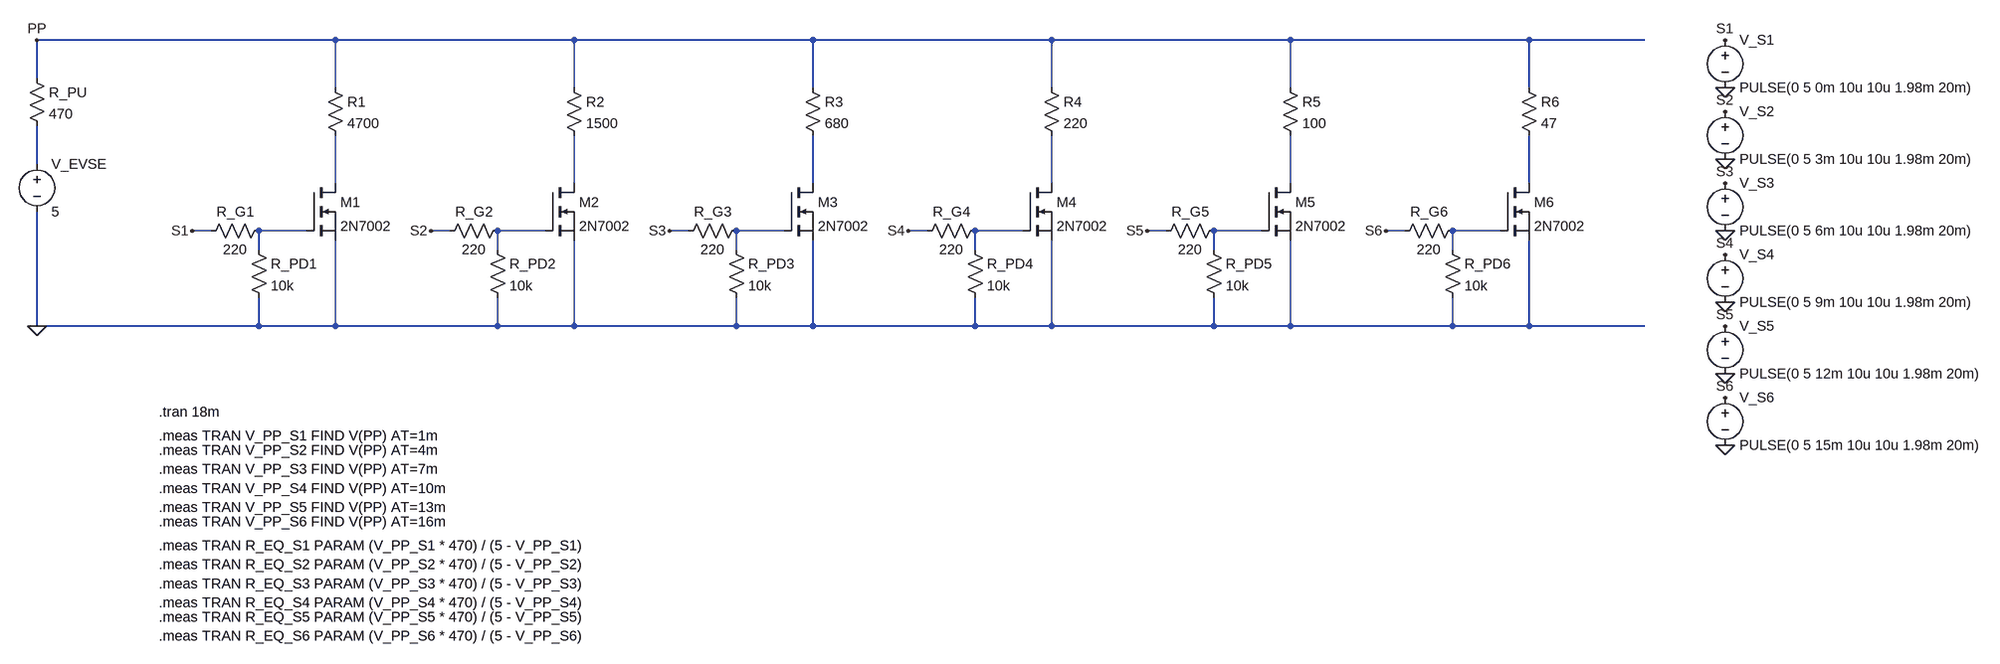
[diagram p0: schematic Barramento_PP_2N7002.asc]
Barramento_PP_2N7002.asc, the LTspice schematic file:
Version 4.1
SHEET 1 3256 1400
WIRE 400 80 -100 80
WIRE 800 80 400 80
WIRE 1200 80 800 80
WIRE 1600 80 1200 80
WIRE 2000 80 1600 80
WIRE 2400 80 2000 80
WIRE 2600 80 2400 80
WIRE -100 144 -100 80
WIRE 400 160 400 80
WIRE 800 160 800 80
WIRE 1200 160 1200 80
WIRE 1600 160 1600 80
WIRE 2000 160 2000 80
WIRE 2400 160 2400 80
WIRE -100 288 -100 224
WIRE 400 320 400 240
WIRE 800 320 800 240
WIRE 1200 320 1200 240
WIRE 1600 320 1600 240
WIRE 2000 320 2000 240
WIRE 2400 320 2400 240
WIRE 192 400 160 400
WIRE 352 400 272 400
WIRE 592 400 560 400
WIRE 752 400 672 400
WIRE 992 400 960 400
WIRE 1152 400 1072 400
WIRE 1392 400 1360 400
WIRE 1552 400 1472 400
WIRE 1792 400 1760 400
WIRE 1952 400 1872 400
WIRE 2192 400 2160 400
WIRE 2352 400 2272 400
WIRE 272 432 272 400
WIRE 672 432 672 400
WIRE 1072 432 1072 400
WIRE 1472 432 1472 400
WIRE 1872 432 1872 400
WIRE 2272 432 2272 400
WIRE -100 560 -100 368
WIRE 272 560 272 512
WIRE 272 560 -100 560
WIRE 400 560 400 416
WIRE 400 560 272 560
WIRE 672 560 672 512
WIRE 672 560 400 560
WIRE 800 560 800 416
WIRE 800 560 672 560
WIRE 1072 560 1072 512
WIRE 1072 560 800 560
WIRE 1200 560 1200 416
WIRE 1200 560 1072 560
WIRE 1472 560 1472 512
WIRE 1472 560 1200 560
WIRE 1600 560 1600 416
WIRE 1600 560 1472 560
WIRE 1872 560 1872 512
WIRE 1872 560 1600 560
WIRE 2000 560 2000 416
WIRE 2000 560 1872 560
WIRE 2272 560 2272 512
WIRE 2272 560 2000 560
WIRE 2400 560 2400 416
WIRE 2400 560 2272 560
WIRE 2600 560 2400 560
FLAG -100 80 PP
FLAG -100 560 0
FLAG 160 400 S1
FLAG 560 400 S2
FLAG 960 400 S3
FLAG 1360 400 S4
FLAG 1760 400 S5
FLAG 2160 400 S6
FLAG 2800 160 0
FLAG 2800 280 0
FLAG 2800 400 0
FLAG 2800 520 0
FLAG 2800 640 0
FLAG 2800 760 0
FLAG 2800 80 S1
FLAG 2800 200 S2
FLAG 2800 320 S3
FLAG 2800 440 S4
FLAG 2800 560 S5
FLAG 2800 680 S6
SYMBOL res -116 128 R0
SYMATTR InstName R_PU
SYMATTR Value 470
SYMBOL voltage -100 272 R0
WINDOW 123 0 0 Left 2
WINDOW 39 0 0 Left 2
SYMATTR InstName V_EVSE
SYMATTR Value 5
SYMBOL res 384 144 R0
SYMATTR InstName R1
SYMATTR Value 4700
SYMBOL nmos 352 320 R0
SYMATTR InstName M1
SYMATTR Value 2N7002
SYMBOL res 256 416 R0
SYMATTR InstName R_PD1
SYMATTR Value 10k
SYMBOL res 288 384 R90
WINDOW 0 0 56 VBottom 2
WINDOW 3 32 56 VTop 2
SYMATTR InstName R_G1
SYMATTR Value 220
SYMBOL res 784 144 R0
SYMATTR InstName R2
SYMATTR Value 1500
SYMBOL nmos 752 320 R0
SYMATTR InstName M2
SYMATTR Value 2N7002
SYMBOL res 656 416 R0
SYMATTR InstName R_PD2
SYMATTR Value 10k
SYMBOL res 688 384 R90
WINDOW 0 0 56 VBottom 2
WINDOW 3 32 56 VTop 2
SYMATTR InstName R_G2
SYMATTR Value 220
SYMBOL res 1184 144 R0
SYMATTR InstName R3
SYMATTR Value 680
SYMBOL nmos 1152 320 R0
SYMATTR InstName M3
SYMATTR Value 2N7002
SYMBOL res 1056 416 R0
SYMATTR InstName R_PD3
SYMATTR Value 10k
SYMBOL res 1088 384 R90
WINDOW 0 0 56 VBottom 2
WINDOW 3 32 56 VTop 2
SYMATTR InstName R_G3
SYMATTR Value 220
SYMBOL res 1584 144 R0
SYMATTR InstName R4
SYMATTR Value 220
SYMBOL nmos 1552 320 R0
SYMATTR InstName M4
SYMATTR Value 2N7002
SYMBOL res 1456 416 R0
SYMATTR InstName R_PD4
SYMATTR Value 10k
SYMBOL res 1488 384 R90
WINDOW 0 0 56 VBottom 2
WINDOW 3 32 56 VTop 2
SYMATTR InstName R_G4
SYMATTR Value 220
SYMBOL res 1984 144 R0
SYMATTR InstName R5
SYMATTR Value 100
SYMBOL nmos 1952 320 R0
SYMATTR InstName M5
SYMATTR Value 2N7002
SYMBOL res 1856 416 R0
SYMATTR InstName R_PD5
SYMATTR Value 10k
SYMBOL res 1888 384 R90
WINDOW 0 0 56 VBottom 2
WINDOW 3 32 56 VTop 2
SYMATTR InstName R_G5
SYMATTR Value 220
SYMBOL res 2384 144 R0
SYMATTR InstName R6
SYMATTR Value 47
SYMBOL nmos 2352 320 R0
SYMATTR InstName M6
SYMATTR Value 2N7002
SYMBOL res 2256 416 R0
SYMATTR InstName R_PD6
SYMATTR Value 10k
SYMBOL res 2288 384 R90
WINDOW 0 0 56 VBottom 2
WINDOW 3 32 56 VTop 2
SYMATTR InstName R_G6
SYMATTR Value 220
SYMBOL voltage 2800 64 R0
WINDOW 123 0 0 Left 2
WINDOW 39 0 0 Left 2
SYMATTR InstName V_S1
SYMATTR Value PULSE(0 5 0m 10u 10u 1.98m 20m)
SYMBOL voltage 2800 184 R0
WINDOW 123 0 0 Left 2
WINDOW 39 0 0 Left 2
SYMATTR InstName V_S2
SYMATTR Value PULSE(0 5 3m 10u 10u 1.98m 20m)
SYMBOL voltage 2800 304 R0
WINDOW 123 0 0 Left 2
WINDOW 39 0 0 Left 2
SYMATTR InstName V_S3
SYMATTR Value PULSE(0 5 6m 10u 10u 1.98m 20m)
SYMBOL voltage 2800 424 R0
WINDOW 123 0 0 Left 2
WINDOW 39 0 0 Left 2
SYMATTR InstName V_S4
SYMATTR Value PULSE(0 5 9m 10u 10u 1.98m 20m)
SYMBOL voltage 2800 544 R0
WINDOW 123 0 0 Left 2
WINDOW 39 0 0 Left 2
SYMATTR InstName V_S5
SYMATTR Value PULSE(0 5 12m 10u 10u 1.98m 20m)
SYMBOL voltage 2800 664 R0
WINDOW 123 0 0 Left 2
WINDOW 39 0 0 Left 2
SYMATTR InstName V_S6
SYMATTR Value PULSE(0 5 15m 10u 10u 1.98m 20m)
TEXT 104 704 Left 2 !.tran 18m
TEXT 104 744 Left 2 !.meas TRAN V_PP_S1 FIND V(PP) AT=1m
TEXT 104 768 Left 2 !.meas TRAN V_PP_S2 FIND V(PP) AT=4m
TEXT 104 800 Left 2 !.meas TRAN V_PP_S3 FIND V(PP) AT=7m
TEXT 104 832 Left 2 !.meas TRAN V_PP_S4 FIND V(PP) AT=10m
TEXT 104 864 Left 2 !.meas TRAN V_PP_S5 FIND V(PP) AT=13m
TEXT 104 888 Left 2 !.meas TRAN V_PP_S6 FIND V(PP) AT=16m
TEXT 104 928 Left 2 !.meas TRAN R_EQ_S1 PARAM (V_PP_S1 * 470) / (5 - V_PP_S1)
TEXT 104 960 Left 2 !.meas TRAN R_EQ_S2 PARAM (V_PP_S2 * 470) / (5 - V_PP_S2)
TEXT 104 992 Left 2 !.meas TRAN R_EQ_S3 PARAM (V_PP_S3 * 470) / (5 - V_PP_S3)
TEXT 104 1024 Left 2 !.meas TRAN R_EQ_S4 PARAM (V_PP_S4 * 470) / (5 - V_PP_S4)
TEXT 104 1048 Left 2 !.meas TRAN R_EQ_S5 PARAM (V_PP_S5 * 470) / (5 - V_PP_S5)
TEXT 104 1080 Left 2 !.meas TRAN R_EQ_S6 PARAM (V_PP_S6 * 470) / (5 - V_PP_S6)

The netlist it stands for:
* Barramento_PP_2N7002.asc
R_PU PP N001 470
V_EVSE N001 0 5
R1 PP N002 4700
M1 N002 N008 0 0 2N7002
R_PD1 N008 0 10k
R_G1 N008 S1 220
R2 PP N003 1500
M2 N003 N009 0 0 2N7002
R_PD2 N009 0 10k
R_G2 N009 S2 220
R3 PP N004 680
M3 N004 N010 0 0 2N7002
R_PD3 N010 0 10k
R_G3 N010 S3 220
R4 PP N005 220
M4 N005 N011 0 0 2N7002
R_PD4 N011 0 10k
R_G4 N011 S4 220
R5 PP N006 100
M5 N006 N012 0 0 2N7002
R_PD5 N012 0 10k
R_G5 N012 S5 220
R6 PP N007 47
M6 N007 N013 0 0 2N7002
R_PD6 N013 0 10k
R_G6 N013 S6 220
V_S1 S1 0 PULSE(0 5 0m 10u 10u 1.98m 20m)
V_S2 S2 0 PULSE(0 5 3m 10u 10u 1.98m 20m)
V_S3 S3 0 PULSE(0 5 6m 10u 10u 1.98m 20m)
V_S4 S4 0 PULSE(0 5 9m 10u 10u 1.98m 20m)
V_S5 S5 0 PULSE(0 5 12m 10u 10u 1.98m 20m)
V_S6 S6 0 PULSE(0 5 15m 10u 10u 1.98m 20m)
.model NMOS NMOS
.model PMOS PMOS
.lib standard.mos
.tran 18m
.meas TRAN V_PP_S1 FIND V(PP) AT=1m
.meas TRAN V_PP_S2 FIND V(PP) AT=4m
.meas TRAN V_PP_S3 FIND V(PP) AT=7m
.meas TRAN V_PP_S4 FIND V(PP) AT=10m
.meas TRAN V_PP_S5 FIND V(PP) AT=13m
.meas TRAN V_PP_S6 FIND V(PP) AT=16m
.meas TRAN R_EQ_S1 PARAM (V_PP_S1 * 470) / (5 - V_PP_S1)
.meas TRAN R_EQ_S2 PARAM (V_PP_S2 * 470) / (5 - V_PP_S2)
.meas TRAN R_EQ_S3 PARAM (V_PP_S3 * 470) / (5 - V_PP_S3)
.meas TRAN R_EQ_S4 PARAM (V_PP_S4 * 470) / (5 - V_PP_S4)
.meas TRAN R_EQ_S5 PARAM (V_PP_S5 * 470) / (5 - V_PP_S5)
.meas TRAN R_EQ_S6 PARAM (V_PP_S6 * 470) / (5 - V_PP_S6)
.backanno
.end